# Altium schematic sheet push-button-switch-7.SchDoc
size A4; SheetNumber: 7; SheetTotal: 17
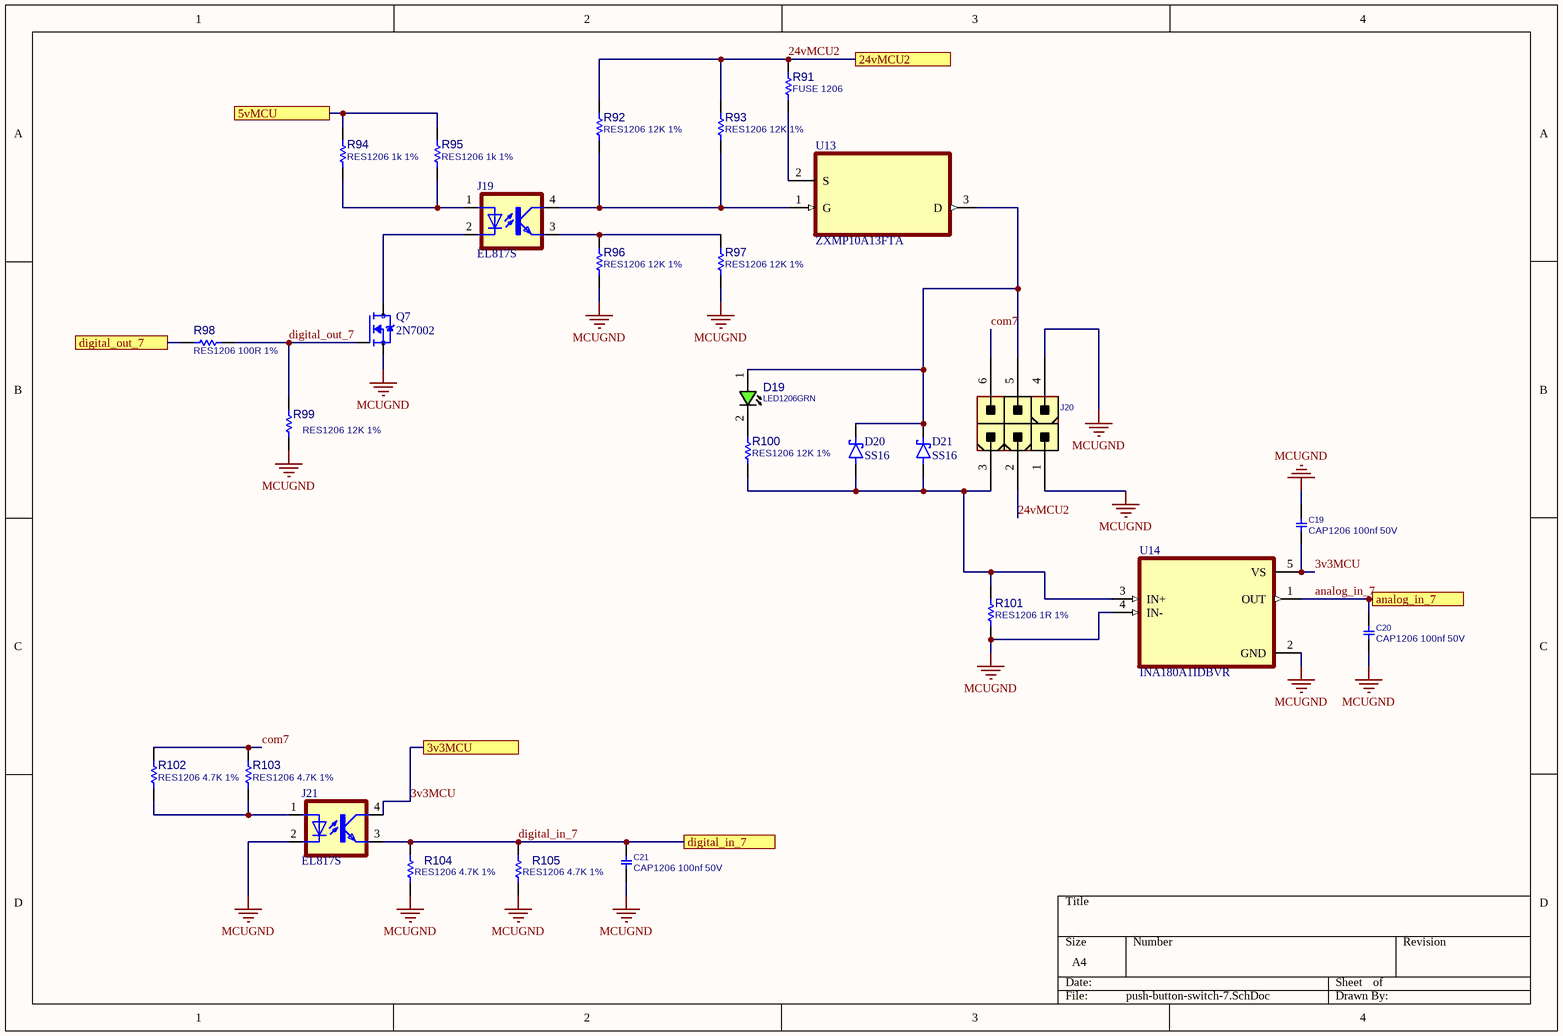
[diagram p0: push-button-switch-7.SchDoc]

## Parts
C19  CAP1206 100nf 50V  [C1206]
C20  CAP1206 100nf 50V  [C1206]
C21  CAP1206 100nf 50V  [C1206]
D19  LED1206GRN  [LED1206GRN]
D20  SS16  [DIOM4325X250N]
D21  SS16  [DIOM4325X250N]
J19  EL817S  [SOIC254P1030X460-4N]
J20  CONN_ATXPWR_6  [ATXPWR_6]  (value not drawn)
J21  EL817S  [SOIC254P1030X460-4N]
Q7  2N7002  [SOT95P240X111-3N]
R91  FUSE 1206  [R1206]
R92  RES1206 12K 1%  [R1206]
R93  RES1206 12K 1%  [R1206]
R94  RES1206 1k 1%  [R1206]
R95  RES1206 1k 1%  [R1206]
R96  RES1206 12K 1%  [R1206]
R97  RES1206 12K 1%  [R1206]
R98  RES1206 100R 1%  [R1206]
R99  RES1206 12K 1%  [R1206]
R100  RES1206 12K 1%  [R1206]
R101  RES1206 1R 1%  [R1206]
R102  RES1206 4.7K 1%  [R1206]
R103  RES1206 4.7K 1%  [R1206]
R104  RES1206 4.7K 1%  [R1206]
R105  RES1206 4.7K 1%  [R1206]
U13  ZXMP10A13FTA  [SOT95P230X110-3N]
U14  INA180A1IDBVR  [SOT95P280X145-5N]

## Ports
3v3MCU, 5vMCU, 24vMCU2, analog_in_7, digital_in_7, digital_out_7

## Nets
MCUGND: C19.1 C20.2 C21.2 J20.1 J20.4 J21.2(C) Q7.2(S) R96.2 R97.2 R99.2 R101.2 R104.1 R105.1 U14.2(GND) U14.4(IN-)
3v3MCU: C19.2 J21.4(COL) U14.5(VS) ; port 3v3MCU
5vMCU: R94.2 R95.2 ; port 5vMCU
24vMCU2: J20.2 R91.1 R92.1 R93.1 ; port 24vMCU2
analog_in_7: C20.1 U14.1(OUT) ; port analog_in_7
com7: J20.6 R102.2 R103.2
digital_in_7: C21.1 J21.3(EMIT) R104.2 R105.2 ; port digital_in_7
digital_out_7: Q7.1(G) R98.2 R99.1
digital_out_7: R98.1 ; port digital_out_7  [a separate net that carries the same name]
NetD19_1: D19.1(ANODE) D20.C(K) D21.C(K) J20.5 U13.3(D)
NetD19_2: D19.2(CATHODE) R100.1
NetD20_A: D20.A D21.A J20.3 R100.2 R101.1 U14.3(IN+)
NetJ19_1: J19.1(A) R94.1 R95.1
NetJ19_2: J19.2(C) Q7.3(D)
NetJ19_3: J19.3(EMIT) R96.1 R97.1
NetJ19_4: J19.4(COL) R92.2 R93.2 U13.1(G)
NetJ21_1: J21.1(A) R102.1 R103.1
NetR91_2: R91.2 U13.2(S)

## Library data of the parts
C19-C21 = CAP_SMD_MLCC_1206: CAP, MLCC; PARAM: -, -%; MANF_P#: MANF_PART#; PARAM2: -V; PRICE: 100= 1$; MANF: -; ASSEMBLY: ASSEMBLY
D19 = LED_SMD_1206_GRN: LED, SMD, 1206, GREEN; PARAM: 20mA; DESC: DESCRIPTION; PARAM2: 2.2V; MANF: -; ASSEMBLY: ASSEMBLY; PRICE: 36t@Javan; MANF_P#: -; VALUE: LED1206GRN; MountType: SMT; PartType: LED
D20 D21 = SS14: 1A, 40V, Schottky Rectifier; MF: Taiwan Semiconductor; SnapEDA_Link: https://www.snapeda.com/parts/SS14/taiwan/view-part/?ref=snap; Package: SMA-2 Taiwan Semiconductor; Value: *; MP: SS14; Check_prices: https://www.snapeda.com/parts/SS14/taiwan/view-part/?ref=eda
J19 J21 = EL817S: Optoisolator Transistor Output 5000Vrms 1 Channel 4-SMD; MF: Everlight Electronics; SnapEDA_Link: https://www.snapeda.com/parts/EL817S/Everlight+Electronics+Co+Ltd/view-part/?ref=snap; Package: SMD-4 Everlight Electronics Co Ltd; Value: *; MP: EL817S; Check_prices: https://www.snapeda.com/parts/EL817S/Everlight+Electronics+Co+Ltd/view-part/?ref=eda
J20 = CONN_ATXPWR_6: CONN, ATX POWER, 6 P; MANF: TE; MANF_P#: 4-1775099-1; VALUE: CONN_ATXPWR_6; MountType: THD; PACKAGE: ATXPWR-6pin; Part Type: Conn.
Q7 = 2N7002: N-Channel 60V 280mA (Ta) 350mW (Ta) Surface Mount SOT-23-3 (TO-236); MF: {'manufacturer': u'onsemi'}; Package: None; Price: None; Value: *; MP: 2N7002; Availability: Unavailable
R91-R105 = RES_SMD_1206: RESISTOR, SMD; PARAM: 1%, 0.25W; DESC: DESCRIPTION; DIST#: MOUSER; MANF_P#: -; MANF: -; ASSEMBLY: ASSEMBLY; PRICE: -; PARAM2: -
U13 = ZXMP10A13FTA: P-Channel 100 V 600mA (Ta) 625mW (Ta) Surface Mount SOT-23-3; MF: Diodes Inc.; Purchase-URL: https://pricing.snapeda.com/search/part/ZXMP10A13FTA/?ref=eda; Package: SOT-23-3 Diodes Inc.; SnapEDA_Link: https://www.snapeda.com/parts/ZXMP10A13FTA/Diodes+Inc./view-part/?ref=snap; Availability: In Stock; Value: *; MP: ZXMP10A13FTA; Check_prices: https://www.snapeda.com/parts/ZXMP10A13FTA/Diodes+Inc./view-part/?ref=eda; Price: None
U14 = INA180A1IDBVR: 26V, 350kHz current sense amplifier; MF: Texas Instruments; SnapEDA_Link: https://www.snapeda.com/parts/INA180A1IDBVR/Texas+Instruments/view-part/?ref=snap; Package: SOT-23-5 Texas Instruments; Value: *; MP: INA180A1IDBVR; Check_prices: https://www.snapeda.com/parts/INA180A1IDBVR/Texas+Instruments/view-part/?ref=eda